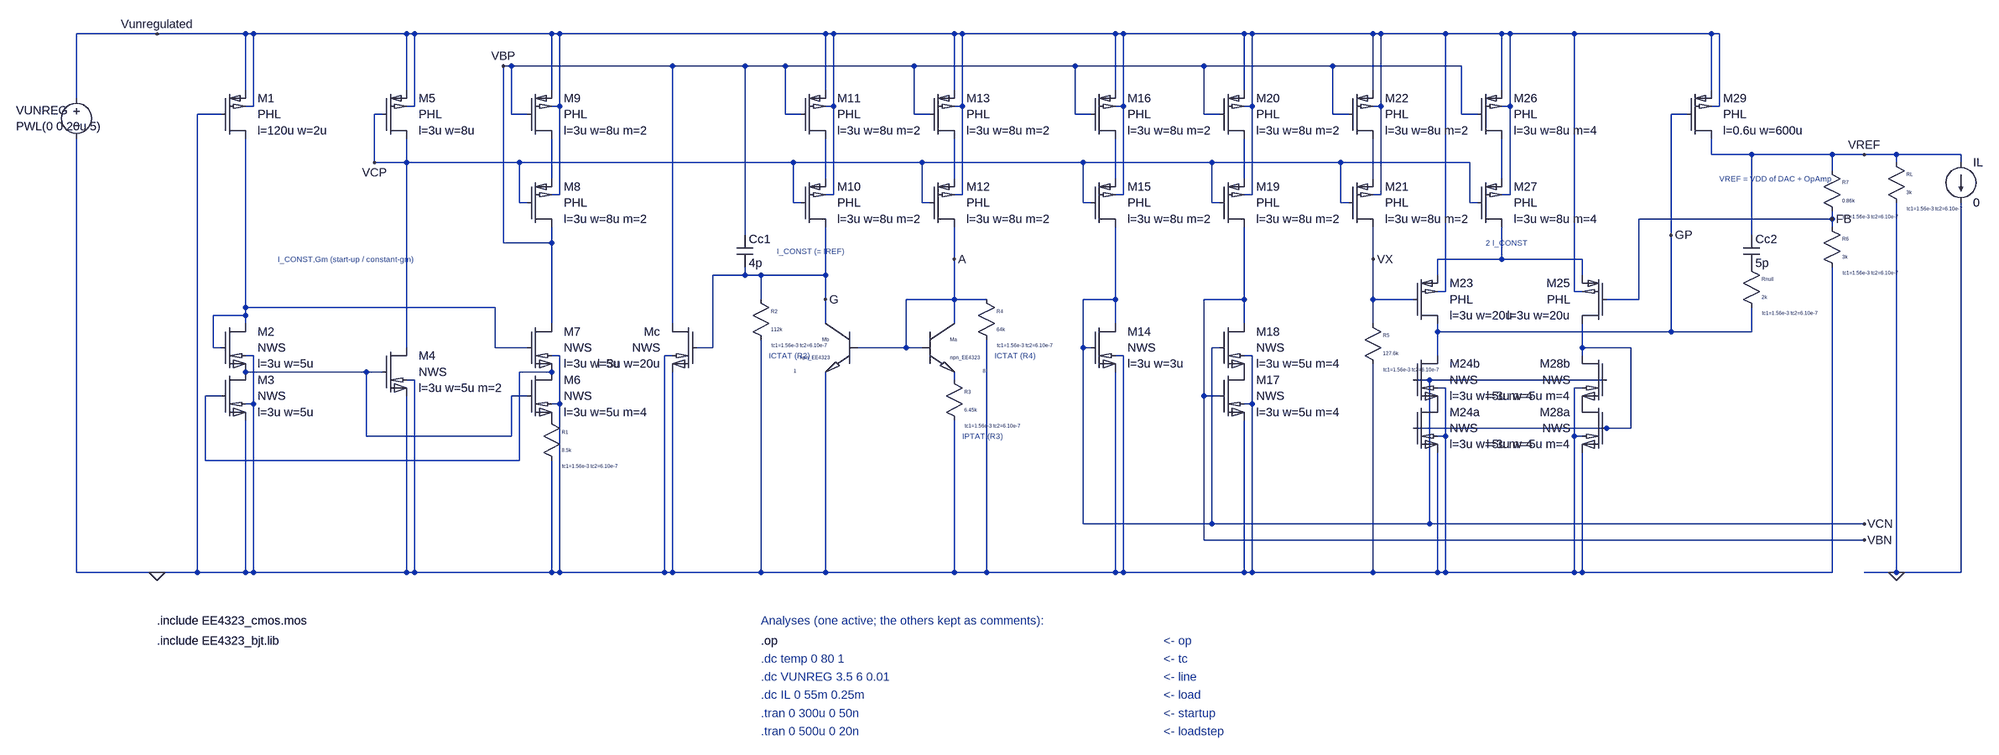
[diagram p0: schematic 02_VREF_Regulator.asc]
02_VREF_Regulator.asc, the LTspice schematic file:
Version 4
SHEET 1 3700 1300
WIRE 176 112 176 0
WIRE 176 144 192 144
WIRE 192 144 192 0
WIRE 128 160 80 160
WIRE 80 160 80 1152
WIRE 176 208 176 576
WIRE 128 624 112 624
WIRE 112 624 112 560
WIRE 112 560 176 560
WIRE 176 640 192 640
WIRE 192 640 192 1152
WIRE 176 736 192 736
WIRE 192 736 192 1152
WIRE 176 768 176 1152
WIRE 176 672 448 672
WIRE 416 672 416 800
WIRE 416 800 704 800
WIRE 704 800 704 720
WIRE 704 720 736 720
WIRE 496 688 512 688
WIRE 512 688 512 1152
WIRE 496 720 496 1152
WIRE 496 112 496 0
WIRE 496 144 512 144
WIRE 512 144 512 0
WIRE 448 160 432 160
WIRE 432 160 432 256
WIRE 496 208 496 256
WIRE 496 256 496 624
WIRE 784 112 784 0
WIRE 784 208 784 288
WIRE 784 144 800 144
WIRE 800 144 800 0
WIRE 784 320 800 320
WIRE 800 320 800 144
WIRE 736 160 704 160
WIRE 704 160 704 64
WIRE 736 336 720 336
WIRE 720 336 720 256
WIRE 784 384 784 576
WIRE 784 416 688 416
WIRE 688 416 688 64
WIRE 176 544 672 544
WIRE 672 544 672 624
WIRE 672 624 736 624
WIRE 784 640 800 640
WIRE 800 640 800 1152
WIRE 784 736 800 736
WIRE 800 736 800 1152
WIRE 784 848 784 1152
WIRE 784 672 720 672
WIRE 720 672 720 848
WIRE 720 848 96 848
WIRE 96 848 96 720
WIRE 96 720 128 720
WIRE 1024 576 1024 64
WIRE 1024 672 1024 1152
WIRE 1024 640 1008 640
WIRE 1008 640 1008 1152
WIRE 1072 624 1104 624
WIRE 1104 624 1104 480
WIRE 1104 480 1328 480
WIRE 1168 400 1168 64
WIRE 1168 464 1168 480
WIRE 1200 528 1200 480
WIRE 1200 608 1200 1152
WIRE 1328 112 1328 0
WIRE 1328 208 1328 288
WIRE 1328 144 1344 144
WIRE 1344 144 1344 0
WIRE 1328 320 1344 320
WIRE 1344 320 1344 144
WIRE 1280 160 1248 160
WIRE 1248 160 1248 64
WIRE 1280 336 1264 336
WIRE 1264 336 1264 256
WIRE 1328 384 1328 576
WIRE 1328 672 1328 1152
WIRE 1584 112 1584 0
WIRE 1584 208 1584 288
WIRE 1584 144 1600 144
WIRE 1600 144 1600 0
WIRE 1584 320 1600 320
WIRE 1600 320 1600 144
WIRE 1536 160 1504 160
WIRE 1504 160 1504 64
WIRE 1536 336 1520 336
WIRE 1520 336 1520 256
WIRE 1584 384 1584 576
WIRE 1520 624 1488 624
WIRE 1488 624 1488 528
WIRE 1488 528 1584 528
WIRE 1392 624 1488 624
WIRE 1584 672 1584 688
WIRE 1584 768 1584 1152
WIRE 1584 528 1648 528
WIRE 1648 608 1648 1152
WIRE 1904 112 1904 0
WIRE 1904 208 1904 288
WIRE 1904 144 1920 144
WIRE 1920 144 1920 0
WIRE 1904 320 1920 320
WIRE 1920 320 1920 144
WIRE 1856 160 1824 160
WIRE 1824 160 1824 64
WIRE 1856 336 1840 336
WIRE 1840 336 1840 256
WIRE 1904 384 1904 576
WIRE 1904 640 1920 640
WIRE 1920 640 1920 1152
WIRE 1904 672 1904 1152
WIRE 1856 624 1840 624
WIRE 1840 624 1840 528
WIRE 1840 528 1904 528
WIRE 1840 624 1840 1056
WIRE 2160 112 2160 0
WIRE 2160 208 2160 288
WIRE 2160 144 2176 144
WIRE 2176 144 2176 0
WIRE 2160 320 2176 320
WIRE 2176 320 2176 144
WIRE 2112 160 2080 160
WIRE 2080 160 2080 64
WIRE 2112 336 2096 336
WIRE 2096 336 2096 256
WIRE 2160 384 2160 576
WIRE 2160 640 2176 640
WIRE 2176 640 2176 1152
WIRE 2160 736 2176 736
WIRE 2176 736 2176 1152
WIRE 2160 768 2160 1152
WIRE 2112 720 2080 720
WIRE 2080 720 2080 528
WIRE 2080 528 2160 528
WIRE 2080 720 2080 1088
WIRE 2112 624 2096 624
WIRE 2096 624 2096 1056
WIRE 2416 112 2416 0
WIRE 2416 208 2416 288
WIRE 2416 144 2432 144
WIRE 2432 144 2432 0
WIRE 2416 320 2432 320
WIRE 2432 320 2432 144
WIRE 2368 160 2336 160
WIRE 2336 160 2336 64
WIRE 2368 336 2352 336
WIRE 2352 336 2352 256
WIRE 2416 384 2416 576
WIRE 2416 656 2416 1152
WIRE 2672 112 2672 0
WIRE 2672 208 2672 288
WIRE 2672 144 2688 144
WIRE 2688 144 2688 0
WIRE 2672 320 2688 320
WIRE 2688 320 2688 144
WIRE 2624 160 2592 160
WIRE 2592 160 2592 64
WIRE 2624 336 2608 336
WIRE 2608 336 2608 256
WIRE 2672 384 2672 448
WIRE 2544 448 2832 448
WIRE 2544 480 2544 448
WIRE 2832 480 2832 448
WIRE 2544 512 2560 512
WIRE 2560 512 2560 0
WIRE 2832 512 2816 512
WIRE 2816 512 2816 0
WIRE 2416 528 2496 528
WIRE 2544 576 2544 640
WIRE 2832 576 2832 640
WIRE 2544 704 2560 704
WIRE 2560 704 2560 1152
WIRE 2544 800 2560 800
WIRE 2832 704 2816 704
WIRE 2816 704 2816 1152
WIRE 2832 800 2816 800
WIRE 2544 832 2544 1152
WIRE 2832 832 2832 1152
WIRE 2496 688 2880 688
WIRE 2528 688 2528 1056
WIRE 2496 784 2880 784
WIRE 2832 624 2928 624
WIRE 2928 624 2928 784
WIRE 2928 784 2880 784
WIRE 3088 112 3088 0
WIRE 3088 144 3104 144
WIRE 3104 144 3104 0
WIRE 2544 592 3008 592
WIRE 3008 592 3008 160
WIRE 3008 160 3040 160
WIRE 3088 208 3088 240
WIRE 3088 240 3392 240
WIRE 3328 240 3328 272
WIRE 3328 352 3328 384
WIRE 3328 464 3328 1152
WIRE 3328 368 2944 368
WIRE 2944 368 2944 528
WIRE 2944 528 2880 528
WIRE 3168 400 3168 240
WIRE 3168 544 3168 592
WIRE 3168 592 3008 592
WIRE 0 0 176 0
WIRE 176 0 192 0
WIRE 192 0 496 0
WIRE 496 0 512 0
WIRE 512 0 784 0
WIRE 784 0 800 0
WIRE 800 0 1328 0
WIRE 1328 0 1344 0
WIRE 1344 0 1584 0
WIRE 1584 0 1600 0
WIRE 1600 0 1904 0
WIRE 1904 0 1920 0
WIRE 1920 0 2160 0
WIRE 2160 0 2176 0
WIRE 2176 0 2416 0
WIRE 2416 0 2432 0
WIRE 2432 0 2560 0
WIRE 2560 0 2672 0
WIRE 2672 0 2688 0
WIRE 2688 0 2816 0
WIRE 2816 0 3088 0
WIRE 3088 0 3104 0
WIRE 0 1152 80 1152
WIRE 80 1152 176 1152
WIRE 176 1152 192 1152
WIRE 192 1152 496 1152
WIRE 496 1152 512 1152
WIRE 512 1152 784 1152
WIRE 784 1152 800 1152
WIRE 800 1152 1008 1152
WIRE 1008 1152 1024 1152
WIRE 1024 1152 1200 1152
WIRE 1200 1152 1328 1152
WIRE 1328 1152 1584 1152
WIRE 1584 1152 1648 1152
WIRE 1648 1152 1904 1152
WIRE 1904 1152 1920 1152
WIRE 1920 1152 2160 1152
WIRE 2160 1152 2176 1152
WIRE 2176 1152 2416 1152
WIRE 2416 1152 2544 1152
WIRE 2544 1152 2560 1152
WIRE 2560 1152 2816 1152
WIRE 2816 1152 2832 1152
WIRE 2832 1152 3328 1152
WIRE 688 64 704 64
WIRE 704 64 1024 64
WIRE 1024 64 1168 64
WIRE 1168 64 1248 64
WIRE 1248 64 1504 64
WIRE 1504 64 1824 64
WIRE 1824 64 2080 64
WIRE 2080 64 2336 64
WIRE 2336 64 2592 64
WIRE 432 256 496 256
WIRE 496 256 720 256
WIRE 720 256 1264 256
WIRE 1264 256 1520 256
WIRE 1520 256 1840 256
WIRE 1840 256 2096 256
WIRE 2096 256 2352 256
WIRE 2352 256 2608 256
WIRE 1840 1056 2096 1056
WIRE 2096 1056 2528 1056
WIRE 2528 1056 3392 1056
WIRE 2080 1088 3392 1088
WIRE -160 128 -160 0
WIRE -160 0 0 0
WIRE -160 208 -160 1152
WIRE -160 1152 0 1152
WIRE 3392 240 3456 240
WIRE 3456 240 3456 256
WIRE 3456 336 3456 1152
WIRE 3456 1152 3392 1152
WIRE 3456 240 3584 240
WIRE 3584 240 3584 256
WIRE 3584 336 3584 1152
WIRE 3584 1152 3456 1152
FLAG 0 0 Vunregulated
FLAG 0 1152 0
FLAG 688 64 VBP
FLAG 432 256 VCP
FLAG 3392 240 VREF
FLAG 3392 1056 VCN
FLAG 3392 1088 VBN
FLAG 2416 448 VX
FLAG 1328 528 G
FLAG 1584 448 A
FLAG 3328 368 FB
FLAG 3008 400 GP
FLAG 3456 1152 0
SYMBOL pmos_PHL 128 112 R0
WINDOW 0 72 16 Left 2
WINDOW 3 72 48 Left 2
WINDOW 123 72 80 Left 2
SYMATTR InstName M1
SYMATTR Value PHL
SYMATTR Value2 l=120u w=2u
SYMBOL nmos_NWS 128 576 R0
WINDOW 0 72 16 Left 2
WINDOW 3 72 48 Left 2
WINDOW 123 72 80 Left 2
SYMATTR InstName M2
SYMATTR Value NWS
SYMATTR Value2 l=3u w=5u
SYMBOL nmos_NWS 128 672 R0
WINDOW 0 72 16 Left 2
WINDOW 3 72 48 Left 2
WINDOW 123 72 80 Left 2
SYMATTR InstName M3
SYMATTR Value NWS
SYMATTR Value2 l=3u w=5u
SYMBOL nmos_NWS 448 624 R0
WINDOW 0 72 16 Left 2
WINDOW 3 72 48 Left 2
WINDOW 123 72 80 Left 2
SYMATTR InstName M4
SYMATTR Value NWS
SYMATTR Value2 l=3u w=5u m=2
SYMBOL pmos_PHL 448 112 R0
WINDOW 0 72 16 Left 2
WINDOW 3 72 48 Left 2
WINDOW 123 72 80 Left 2
SYMATTR InstName M5
SYMATTR Value PHL
SYMATTR Value2 l=3u w=8u
SYMBOL pmos_PHL 736 112 R0
WINDOW 0 72 16 Left 2
WINDOW 3 72 48 Left 2
WINDOW 123 72 80 Left 2
SYMATTR InstName M9
SYMATTR Value PHL
SYMATTR Value2 l=3u w=8u m=2
SYMBOL pmos_PHL 736 288 R0
WINDOW 0 72 16 Left 2
WINDOW 3 72 48 Left 2
WINDOW 123 72 80 Left 2
SYMATTR InstName M8
SYMATTR Value PHL
SYMATTR Value2 l=3u w=8u m=2
SYMBOL nmos_NWS 736 576 R0
WINDOW 0 72 16 Left 2
WINDOW 3 72 48 Left 2
WINDOW 123 72 80 Left 2
SYMATTR InstName M7
SYMATTR Value NWS
SYMATTR Value2 l=3u w=5u
SYMBOL nmos_NWS 736 672 R0
WINDOW 0 72 16 Left 2
WINDOW 3 72 48 Left 2
WINDOW 123 72 80 Left 2
SYMATTR InstName M6
SYMATTR Value NWS
SYMATTR Value2 l=3u w=5u m=4
SYMBOL R_ndiff 768 752 R0
SYMATTR InstName R1
SYMATTR Value 8.5k
SYMATTR Value2 tc1=1.56e-3 tc2=6.10e-7
SYMBOL nmos_NWS 1072 576 M0
WINDOW 0 72 16 Left 2
WINDOW 3 72 48 Left 2
WINDOW 123 72 80 Left 2
SYMATTR InstName Mc
SYMATTR Value NWS
SYMATTR Value2 l=3u w=20u
SYMBOL cap 1152 400 R0
SYMATTR InstName Cc1
SYMATTR Value 4p
SYMBOL R_ndiff 1184 512 R0
SYMATTR InstName R2
SYMATTR Value 112k
SYMATTR Value2 tc1=1.56e-3 tc2=6.10e-7
SYMBOL pmos_PHL 1280 112 R0
WINDOW 0 72 16 Left 2
WINDOW 3 72 48 Left 2
WINDOW 123 72 80 Left 2
SYMATTR InstName M11
SYMATTR Value PHL
SYMATTR Value2 l=3u w=8u m=2
SYMBOL pmos_PHL 1280 288 R0
WINDOW 0 72 16 Left 2
WINDOW 3 72 48 Left 2
WINDOW 123 72 80 Left 2
SYMATTR InstName M10
SYMATTR Value PHL
SYMATTR Value2 l=3u w=8u m=2
SYMBOL npn_npn 1392 576 M0
SYMATTR InstName Mb
SYMATTR Value npn_EE4323
SYMATTR Value2 1
SYMBOL pmos_PHL 1536 112 R0
WINDOW 0 72 16 Left 2
WINDOW 3 72 48 Left 2
WINDOW 123 72 80 Left 2
SYMATTR InstName M13
SYMATTR Value PHL
SYMATTR Value2 l=3u w=8u m=2
SYMBOL pmos_PHL 1536 288 R0
WINDOW 0 72 16 Left 2
WINDOW 3 72 48 Left 2
WINDOW 123 72 80 Left 2
SYMATTR InstName M12
SYMATTR Value PHL
SYMATTR Value2 l=3u w=8u m=2
SYMBOL npn_npn 1520 576 R0
SYMATTR InstName Ma
SYMATTR Value npn_EE4323
SYMATTR Value2 8
SYMBOL R_ndiff 1568 672 R0
SYMATTR InstName R3
SYMATTR Value 6.45k
SYMATTR Value2 tc1=1.56e-3 tc2=6.10e-7
SYMBOL R_ndiff 1632 512 R0
SYMATTR InstName R4
SYMATTR Value 64k
SYMATTR Value2 tc1=1.56e-3 tc2=6.10e-7
SYMBOL pmos_PHL 1856 112 R0
WINDOW 0 72 16 Left 2
WINDOW 3 72 48 Left 2
WINDOW 123 72 80 Left 2
SYMATTR InstName M16
SYMATTR Value PHL
SYMATTR Value2 l=3u w=8u m=2
SYMBOL pmos_PHL 1856 288 R0
WINDOW 0 72 16 Left 2
WINDOW 3 72 48 Left 2
WINDOW 123 72 80 Left 2
SYMATTR InstName M15
SYMATTR Value PHL
SYMATTR Value2 l=3u w=8u m=2
SYMBOL nmos_NWS 1856 576 R0
WINDOW 0 72 16 Left 2
WINDOW 3 72 48 Left 2
WINDOW 123 72 80 Left 2
SYMATTR InstName M14
SYMATTR Value NWS
SYMATTR Value2 l=3u w=3u
SYMBOL pmos_PHL 2112 112 R0
WINDOW 0 72 16 Left 2
WINDOW 3 72 48 Left 2
WINDOW 123 72 80 Left 2
SYMATTR InstName M20
SYMATTR Value PHL
SYMATTR Value2 l=3u w=8u m=2
SYMBOL pmos_PHL 2112 288 R0
WINDOW 0 72 16 Left 2
WINDOW 3 72 48 Left 2
WINDOW 123 72 80 Left 2
SYMATTR InstName M19
SYMATTR Value PHL
SYMATTR Value2 l=3u w=8u m=2
SYMBOL nmos_NWS 2112 576 R0
WINDOW 0 72 16 Left 2
WINDOW 3 72 48 Left 2
WINDOW 123 72 80 Left 2
SYMATTR InstName M18
SYMATTR Value NWS
SYMATTR Value2 l=3u w=5u m=4
SYMBOL nmos_NWS 2112 672 R0
WINDOW 0 72 16 Left 2
WINDOW 3 72 48 Left 2
WINDOW 123 72 80 Left 2
SYMATTR InstName M17
SYMATTR Value NWS
SYMATTR Value2 l=3u w=5u m=4
SYMBOL pmos_PHL 2368 112 R0
WINDOW 0 72 16 Left 2
WINDOW 3 72 48 Left 2
WINDOW 123 72 80 Left 2
SYMATTR InstName M22
SYMATTR Value PHL
SYMATTR Value2 l=3u w=8u m=2
SYMBOL pmos_PHL 2368 288 R0
WINDOW 0 72 16 Left 2
WINDOW 3 72 48 Left 2
WINDOW 123 72 80 Left 2
SYMATTR InstName M21
SYMATTR Value PHL
SYMATTR Value2 l=3u w=8u m=2
SYMBOL R_ndiff 2400 560 R0
SYMATTR InstName R5
SYMATTR Value 127.6k
SYMATTR Value2 tc1=1.56e-3 tc2=6.10e-7
SYMBOL pmos_PHL 2624 112 R0
WINDOW 0 72 16 Left 2
WINDOW 3 72 48 Left 2
WINDOW 123 72 80 Left 2
SYMATTR InstName M26
SYMATTR Value PHL
SYMATTR Value2 l=3u w=8u m=4
SYMBOL pmos_PHL 2624 288 R0
WINDOW 0 72 16 Left 2
WINDOW 3 72 48 Left 2
WINDOW 123 72 80 Left 2
SYMATTR InstName M27
SYMATTR Value PHL
SYMATTR Value2 l=3u w=8u m=4
SYMBOL pmos_PHL 2496 480 R0
WINDOW 0 72 16 Left 2
WINDOW 3 72 48 Left 2
WINDOW 123 72 80 Left 2
SYMATTR InstName M23
SYMATTR Value PHL
SYMATTR Value2 l=3u w=20u
SYMBOL pmos_PHL 2880 480 M0
WINDOW 0 72 16 Left 2
WINDOW 3 72 48 Left 2
WINDOW 123 72 80 Left 2
SYMATTR InstName M25
SYMATTR Value PHL
SYMATTR Value2 l=3u w=20u
SYMBOL nmos_NWS 2496 640 R0
WINDOW 0 72 16 Left 2
WINDOW 3 72 48 Left 2
WINDOW 123 72 80 Left 2
SYMATTR InstName M24b
SYMATTR Value NWS
SYMATTR Value2 l=3u w=5u m=4
SYMBOL nmos_NWS 2496 736 R0
WINDOW 0 72 16 Left 2
WINDOW 3 72 48 Left 2
WINDOW 123 72 80 Left 2
SYMATTR InstName M24a
SYMATTR Value NWS
SYMATTR Value2 l=3u w=5u m=4
SYMBOL nmos_NWS 2880 640 M0
WINDOW 0 72 16 Left 2
WINDOW 3 72 48 Left 2
WINDOW 123 72 80 Left 2
SYMATTR InstName M28b
SYMATTR Value NWS
SYMATTR Value2 l=3u w=5u m=4
SYMBOL nmos_NWS 2880 736 M0
WINDOW 0 72 16 Left 2
WINDOW 3 72 48 Left 2
WINDOW 123 72 80 Left 2
SYMATTR InstName M28a
SYMATTR Value NWS
SYMATTR Value2 l=3u w=5u m=4
SYMBOL pmos_PHL 3040 112 R0
WINDOW 0 72 16 Left 2
WINDOW 3 72 48 Left 2
WINDOW 123 72 80 Left 2
SYMATTR InstName M29
SYMATTR Value PHL
SYMATTR Value2 l=0.6u w=600u
SYMBOL R_ndiff 3312 256 R0
SYMATTR InstName R7
SYMATTR Value 0.86k
SYMATTR Value2 tc1=1.56e-3 tc2=6.10e-7
SYMBOL R_ndiff 3312 368 R0
SYMATTR InstName R6
SYMATTR Value 3k
SYMATTR Value2 tc1=1.56e-3 tc2=6.10e-7
SYMBOL cap 3152 400 R0
SYMATTR InstName Cc2
SYMATTR Value 5p
SYMBOL R_ndiff 3152 448 R0
SYMATTR InstName Rnull
SYMATTR Value 2k
SYMATTR Value2 tc1=1.56e-3 tc2=6.10e-7
SYMBOL voltage -160 112 R0
WINDOW 0 -120 40 Left 2
WINDOW 3 -120 72 Left 2
SYMATTR InstName VUNREG
SYMATTR Value PWL(0 0 20u 5)
SYMBOL R_ndiff 3440 240 R0
SYMATTR InstName RL
SYMATTR Value 3k
SYMATTR Value2 tc1=1.56e-3 tc2=6.10e-7
SYMBOL current 3584 256 R0
SYMATTR InstName IL
SYMATTR Value 0
TEXT 240 448 Left 1 ;I_CONST,Gm (start-up / constant-gm)
TEXT 1232 432 Left 1 ;I_CONST (= IREF)
TEXT 1600 800 Left 1 ;IPTAT (R3)
TEXT 1664 640 Left 1 ;ICTAT (R4)
TEXT 1216 640 Left 1 ;ICTAT (R2)
TEXT 2640 416 Left 1 ;2 I_CONST
TEXT 3104 288 Left 1 ;VREF = VDD of DAC + OpAmp
TEXT 0 1248 Left 2 !.include EE4323_cmos.mos
TEXT 0 1288 Left 2 !.include EE4323_bjt.lib
TEXT 1200 1248 Left 2 ;Analyses (one active; the others kept as comments):
TEXT 1200 1288 Left 2 !.op
TEXT 2000 1288 Left 2 ;<- op
TEXT 1200 1324 Left 2 ;.dc temp 0 80 1
TEXT 2000 1324 Left 2 ;<- tc
TEXT 1200 1360 Left 2 ;.dc VUNREG 3.5 6 0.01
TEXT 2000 1360 Left 2 ;<- line
TEXT 1200 1396 Left 2 ;.dc IL 0 55m 0.25m
TEXT 2000 1396 Left 2 ;<- load
TEXT 1200 1432 Left 2 ;.tran 0 300u 0 50n
TEXT 2000 1432 Left 2 ;<- startup
TEXT 1200 1468 Left 2 ;.tran 0 500u 0 20n
TEXT 2000 1468 Left 2 ;<- loadstep

The netlist it stands for:
* 02_VREF_Regulator.asc
M1 N001 0 Vunregulated Vunregulated PHL l=120u w=2u
M2 N001 N001 N002 0 NWS l=3u w=5u
M3 N002 N004 0 0 NWS l=3u w=5u
M4 VCP N002 0 0 NWS l=3u w=5u m=2
M5 VCP VCP Vunregulated Vunregulated PHL l=3u w=8u
M9 N003 VBP Vunregulated Vunregulated PHL l=3u w=8u m=2
M8 VBP VCP N003 Vunregulated PHL l=3u w=8u m=2
M7 VBP N001 N004 0 NWS l=3u w=5u
M6 N004 N002 P001 0 NWS l=3u w=5u m=4
R1 P001 0 8.5k tc1=1.56e-3 tc2=6.10e-7
Mc VBP G 0 0 NWS l=3u w=20u
Cc1 VBP G 4p
R2 G 0 112k tc1=1.56e-3 tc2=6.10e-7
M11 N005 VBP Vunregulated Vunregulated PHL l=3u w=8u m=2
M10 G VCP N005 Vunregulated PHL l=3u w=8u m=2
Q§Mb G A 0 0 npn_EE4323 1
M13 N006 VBP Vunregulated Vunregulated PHL l=3u w=8u m=2
M12 A VCP N006 Vunregulated PHL l=3u w=8u m=2
Q§Ma A A N007 0 npn_EE4323 8
R3 N007 0 6.45k tc1=1.56e-3 tc2=6.10e-7
R4 A 0 64k tc1=1.56e-3 tc2=6.10e-7
M16 N008 VBP Vunregulated Vunregulated PHL l=3u w=8u m=2
M15 VCN VCP N008 Vunregulated PHL l=3u w=8u m=2
M14 VCN VCN 0 0 NWS l=3u w=3u
M20 N009 VBP Vunregulated Vunregulated PHL l=3u w=8u m=2
M19 VBN VCP N009 Vunregulated PHL l=3u w=8u m=2
M18 VBN VCN P002 0 NWS l=3u w=5u m=4
M17 P002 VBN 0 0 NWS l=3u w=5u m=4
M22 N010 VBP Vunregulated Vunregulated PHL l=3u w=8u m=2
M21 VX VCP N010 Vunregulated PHL l=3u w=8u m=2
R5 VX 0 127.6k tc1=1.56e-3 tc2=6.10e-7
M26 N011 VBP Vunregulated Vunregulated PHL l=3u w=8u m=4
M27 N012 VCP N011 Vunregulated PHL l=3u w=8u m=4
M23 GP VX N012 Vunregulated PHL l=3u w=20u
M25 N013 FB N012 Vunregulated PHL l=3u w=20u
M24b GP VCN P003 0 NWS l=3u w=5u m=4
M24a P003 N013 0 0 NWS l=3u w=5u m=4
M28b N013 VCN P004 0 NWS l=3u w=5u m=4
M28a P004 N013 0 0 NWS l=3u w=5u m=4
M29 VREF GP Vunregulated Vunregulated PHL l=0.6u w=600u
R7 VREF FB 0.86k tc1=1.56e-3 tc2=6.10e-7
R6 FB 0 3k tc1=1.56e-3 tc2=6.10e-7
Cc2 VREF P005 5p
Rnull P005 GP 2k tc1=1.56e-3 tc2=6.10e-7
VUNREG Vunregulated 0 PWL(0 0 20u 5)
RL VREF 0 3k tc1=1.56e-3 tc2=6.10e-7
IL VREF 0 0
.model NPN NPN
.model PNP PNP
.lib standard.bjt
.model NMOS NMOS
.model PMOS PMOS
.lib standard.mos
* I_CONST,Gm (start-up / constant-gm)
* I_CONST (= IREF)
* IPTAT (R3)
* ICTAT (R4)
* ICTAT (R2)
* 2 I_CONST
* VREF = VDD of DAC + OpAmp
.include EE4323_cmos.mos
.include EE4323_bjt.lib
* Analyses (one active; the others kept as comments):
.op
* <- op
* .dc temp 0 80 1
* <- tc
* .dc VUNREG 3.5 6 0.01
* <- line
* .dc IL 0 55m 0.25m
* <- load
* .tran 0 300u 0 50n
* <- startup
* .tran 0 500u 0 20n
* <- loadstep
.backanno
.end